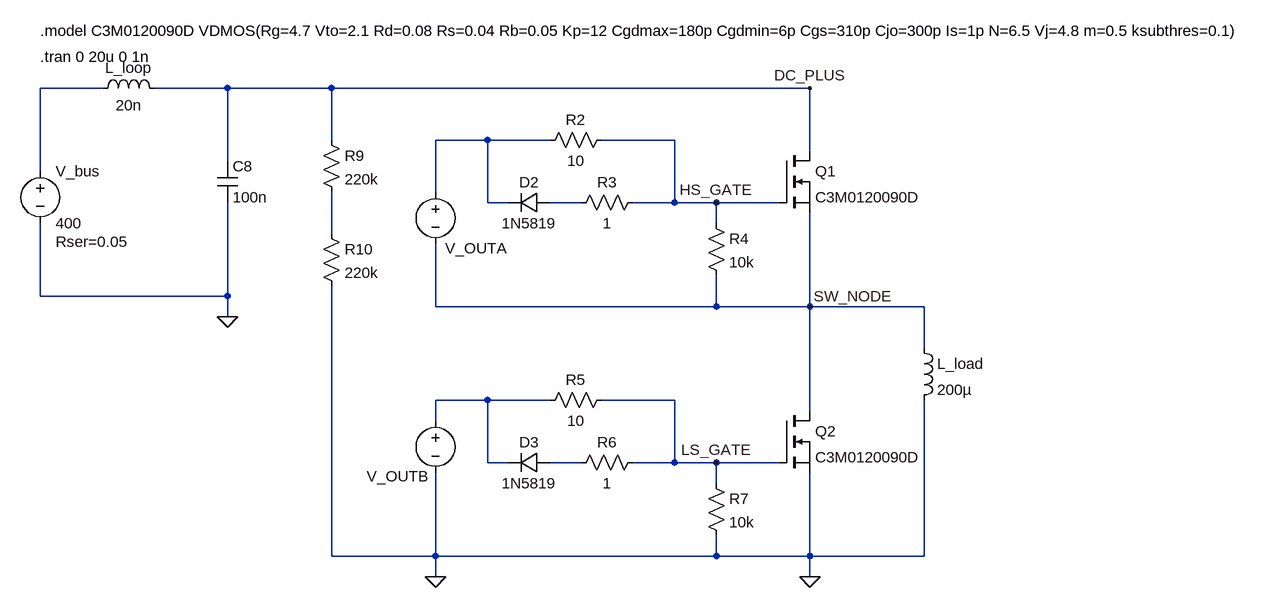
[diagram p0: schematic SiC_HalfBridge.asc]
SiC_HalfBridge.asc, the LTspice schematic file:
Version 4.1
SHEET 1 2280 960
WIRE 256 128 160 128
WIRE 448 128 336 128
WIRE 608 128 448 128
WIRE 1344 128 608 128
WIRE 608 208 608 128
WIRE 848 208 768 208
WIRE 944 208 848 208
WIRE 1136 208 1024 208
WIRE 1344 224 1344 128
WIRE 448 240 448 128
WIRE 160 256 160 128
WIRE 768 288 768 208
WIRE 848 304 848 208
WIRE 880 304 848 304
WIRE 992 304 944 304
WIRE 1136 304 1136 208
WIRE 1136 304 1072 304
WIRE 1200 304 1136 304
WIRE 1296 304 1200 304
WIRE 1200 336 1200 304
WIRE 608 352 608 288
WIRE 160 448 160 336
WIRE 448 448 448 304
WIRE 448 448 160 448
WIRE 768 464 768 368
WIRE 1200 464 1200 416
WIRE 1200 464 768 464
WIRE 1344 464 1344 320
WIRE 1344 464 1200 464
WIRE 1520 464 1344 464
WIRE 448 480 448 448
WIRE 1520 528 1520 464
WIRE 848 608 768 608
WIRE 944 608 848 608
WIRE 1136 608 1024 608
WIRE 1344 624 1344 464
WIRE 768 640 768 608
WIRE 848 704 848 608
WIRE 880 704 848 704
WIRE 992 704 944 704
WIRE 1136 704 1136 608
WIRE 1136 704 1072 704
WIRE 1200 704 1136 704
WIRE 1296 704 1200 704
WIRE 1200 736 1200 704
WIRE 608 848 608 432
WIRE 768 848 768 720
WIRE 768 848 608 848
WIRE 1200 848 1200 816
WIRE 1200 848 768 848
WIRE 1344 848 1344 720
WIRE 1344 848 1200 848
WIRE 1520 848 1520 608
WIRE 1520 848 1344 848
WIRE 768 880 768 848
WIRE 1344 880 1344 848
FLAG 448 480 0
FLAG 1344 880 0
FLAG 768 880 0
FLAG 1344 464 SW_NODE
FLAG 1344 128 DC_PLUS
FLAG 1200 304 HS_GATE
FLAG 1200 704 LS_GATE
SYMBOL voltage 160 240 R0
WINDOW 123 0 0 Left 0
WINDOW 39 24 124 Left 2
SYMATTR SpiceLine Rser=0.05
SYMATTR InstName V_bus
SYMATTR Value 400
SYMBOL ind 240 144 R270
WINDOW 0 32 56 VTop 2
WINDOW 3 5 56 VBottom 2
SYMATTR InstName L_loop
SYMATTR Value 20n
SYMATTR SpiceLine Rser=0.05 Rpar=20
SYMBOL cap 432 240 R0
SYMATTR InstName C8
SYMATTR Value 100n
SYMATTR SpiceLine Rser=50m
SYMBOL res 592 192 R0
SYMATTR InstName R9
SYMATTR Value 220k
SYMBOL res 592 336 R0
SYMATTR InstName R10
SYMATTR Value 220k
SYMBOL nmos 1296 224 R0
SYMATTR InstName Q1
SYMATTR Value C3M0120090D
SYMBOL nmos 1296 624 R0
SYMATTR InstName Q2
SYMATTR Value C3M0120090D
SYMBOL ind 1504 512 R0
SYMATTR InstName L_load
SYMATTR Value 200µ
SYMATTR SpiceLine Rser=20
SYMBOL voltage 768 272 R0
WINDOW 3 24 104 Invisible 2
WINDOW 123 0 0 Left 0
WINDOW 39 24 44 Left 2
WINDOW 0 15 102 Left 2
SYMATTR Value PULSE(0 14 1u 15n 15n 4u 10u)
SYMATTR InstName V_OUTA
SYMBOL res 1040 192 R90
WINDOW 0 0 56 VBottom 2
WINDOW 3 32 56 VTop 2
SYMATTR InstName R2
SYMATTR Value 10
SYMBOL res 1088 288 R90
WINDOW 0 0 56 VBottom 2
WINDOW 3 32 56 VTop 2
SYMATTR InstName R3
SYMATTR Value 1
SYMBOL diode 944 320 M270
WINDOW 0 32 32 VTop 2
WINDOW 3 0 32 VBottom 2
SYMATTR InstName D2
SYMATTR Value 1N5819
SYMBOL res 1184 320 R0
SYMATTR InstName R4
SYMATTR Value 10k
SYMBOL voltage 768 624 R0
WINDOW 3 24 104 Invisible 2
WINDOW 123 0 0 Left 0
WINDOW 39 24 44 Left 2
WINDOW 0 -106 101 Left 2
SYMATTR Value PULSE(15 0 0.78u 15n 15n 4.44u 10u)
SYMATTR InstName V_OUTB
SYMBOL res 1040 592 R90
WINDOW 0 0 56 VBottom 2
WINDOW 3 32 56 VTop 2
SYMATTR InstName R5
SYMATTR Value 10
SYMBOL res 1088 688 R90
WINDOW 0 0 56 VBottom 2
WINDOW 3 32 56 VTop 2
SYMATTR InstName R6
SYMATTR Value 1
SYMBOL diode 944 720 M270
WINDOW 0 32 32 VTop 2
WINDOW 3 0 32 VBottom 2
SYMATTR InstName D3
SYMATTR Value 1N5819
SYMBOL res 1184 720 R0
SYMATTR InstName R7
SYMATTR Value 10k
TEXT 160 40 Left 2 !.model C3M0120090D VDMOS(Rg=4.7 Vto=2.1 Rd=0.08 Rs=0.04 Rb=0.05 Kp=12 Cgdmax=180p Cgdmin=6p Cgs=310p Cjo=300p Is=1p N=6.5 Vj=4.8 m=0.5 ksubthres=0.1)
TEXT 160 80 Left 2 !.tran 0 20u 0 1n

The netlist it stands for:
* SiC_HalfBridge.asc
V_bus N001 0 400 Rser=0.05
L_loop N001 DC_PLUS 20n Rser=0.05 Rpar=20
C8 DC_PLUS 0 100n Rser=50m
R9 DC_PLUS N004 220k
R10 N004 0 220k
M§Q1 DC_PLUS HS_GATE SW_NODE SW_NODE C3M0120090D
M§Q2 SW_NODE LS_GATE 0 0 C3M0120090D
L_load SW_NODE 0 200µ Rser=20
V_OUTA N002 SW_NODE PULSE(0 14 1u 15n 15n 4u 10u)
R2 HS_GATE N002 10
R3 HS_GATE N003 1
D2 N003 N002 1N5819
R4 HS_GATE SW_NODE 10k
V_OUTB N005 0 PULSE(15 0 0.78u 15n 15n 4.44u 10u)
R5 LS_GATE N005 10
R6 LS_GATE N006 1
D3 N006 N005 1N5819
R7 LS_GATE 0 10k
.model D D
.lib standard.dio
.model NMOS NMOS
.model PMOS PMOS
.lib standard.mos
.model C3M0120090D VDMOS(Rg=4.7 Vto=2.1 Rd=0.08 Rs=0.04 Rb=0.05 Kp=12 Cgdmax=180p Cgdmin=6p Cgs=310p Cjo=300p Is=1p N=6.5 Vj=4.8 m=0.5 ksubthres=0.1)
.tran 0 20u 0 1n
.backanno
.end